# Altium schematic sheet 07_LTE_GNSS.SchDoc: LTE_GNSS
size 420 x 297 mm; SheetNumber: 8; SheetTotal: 12
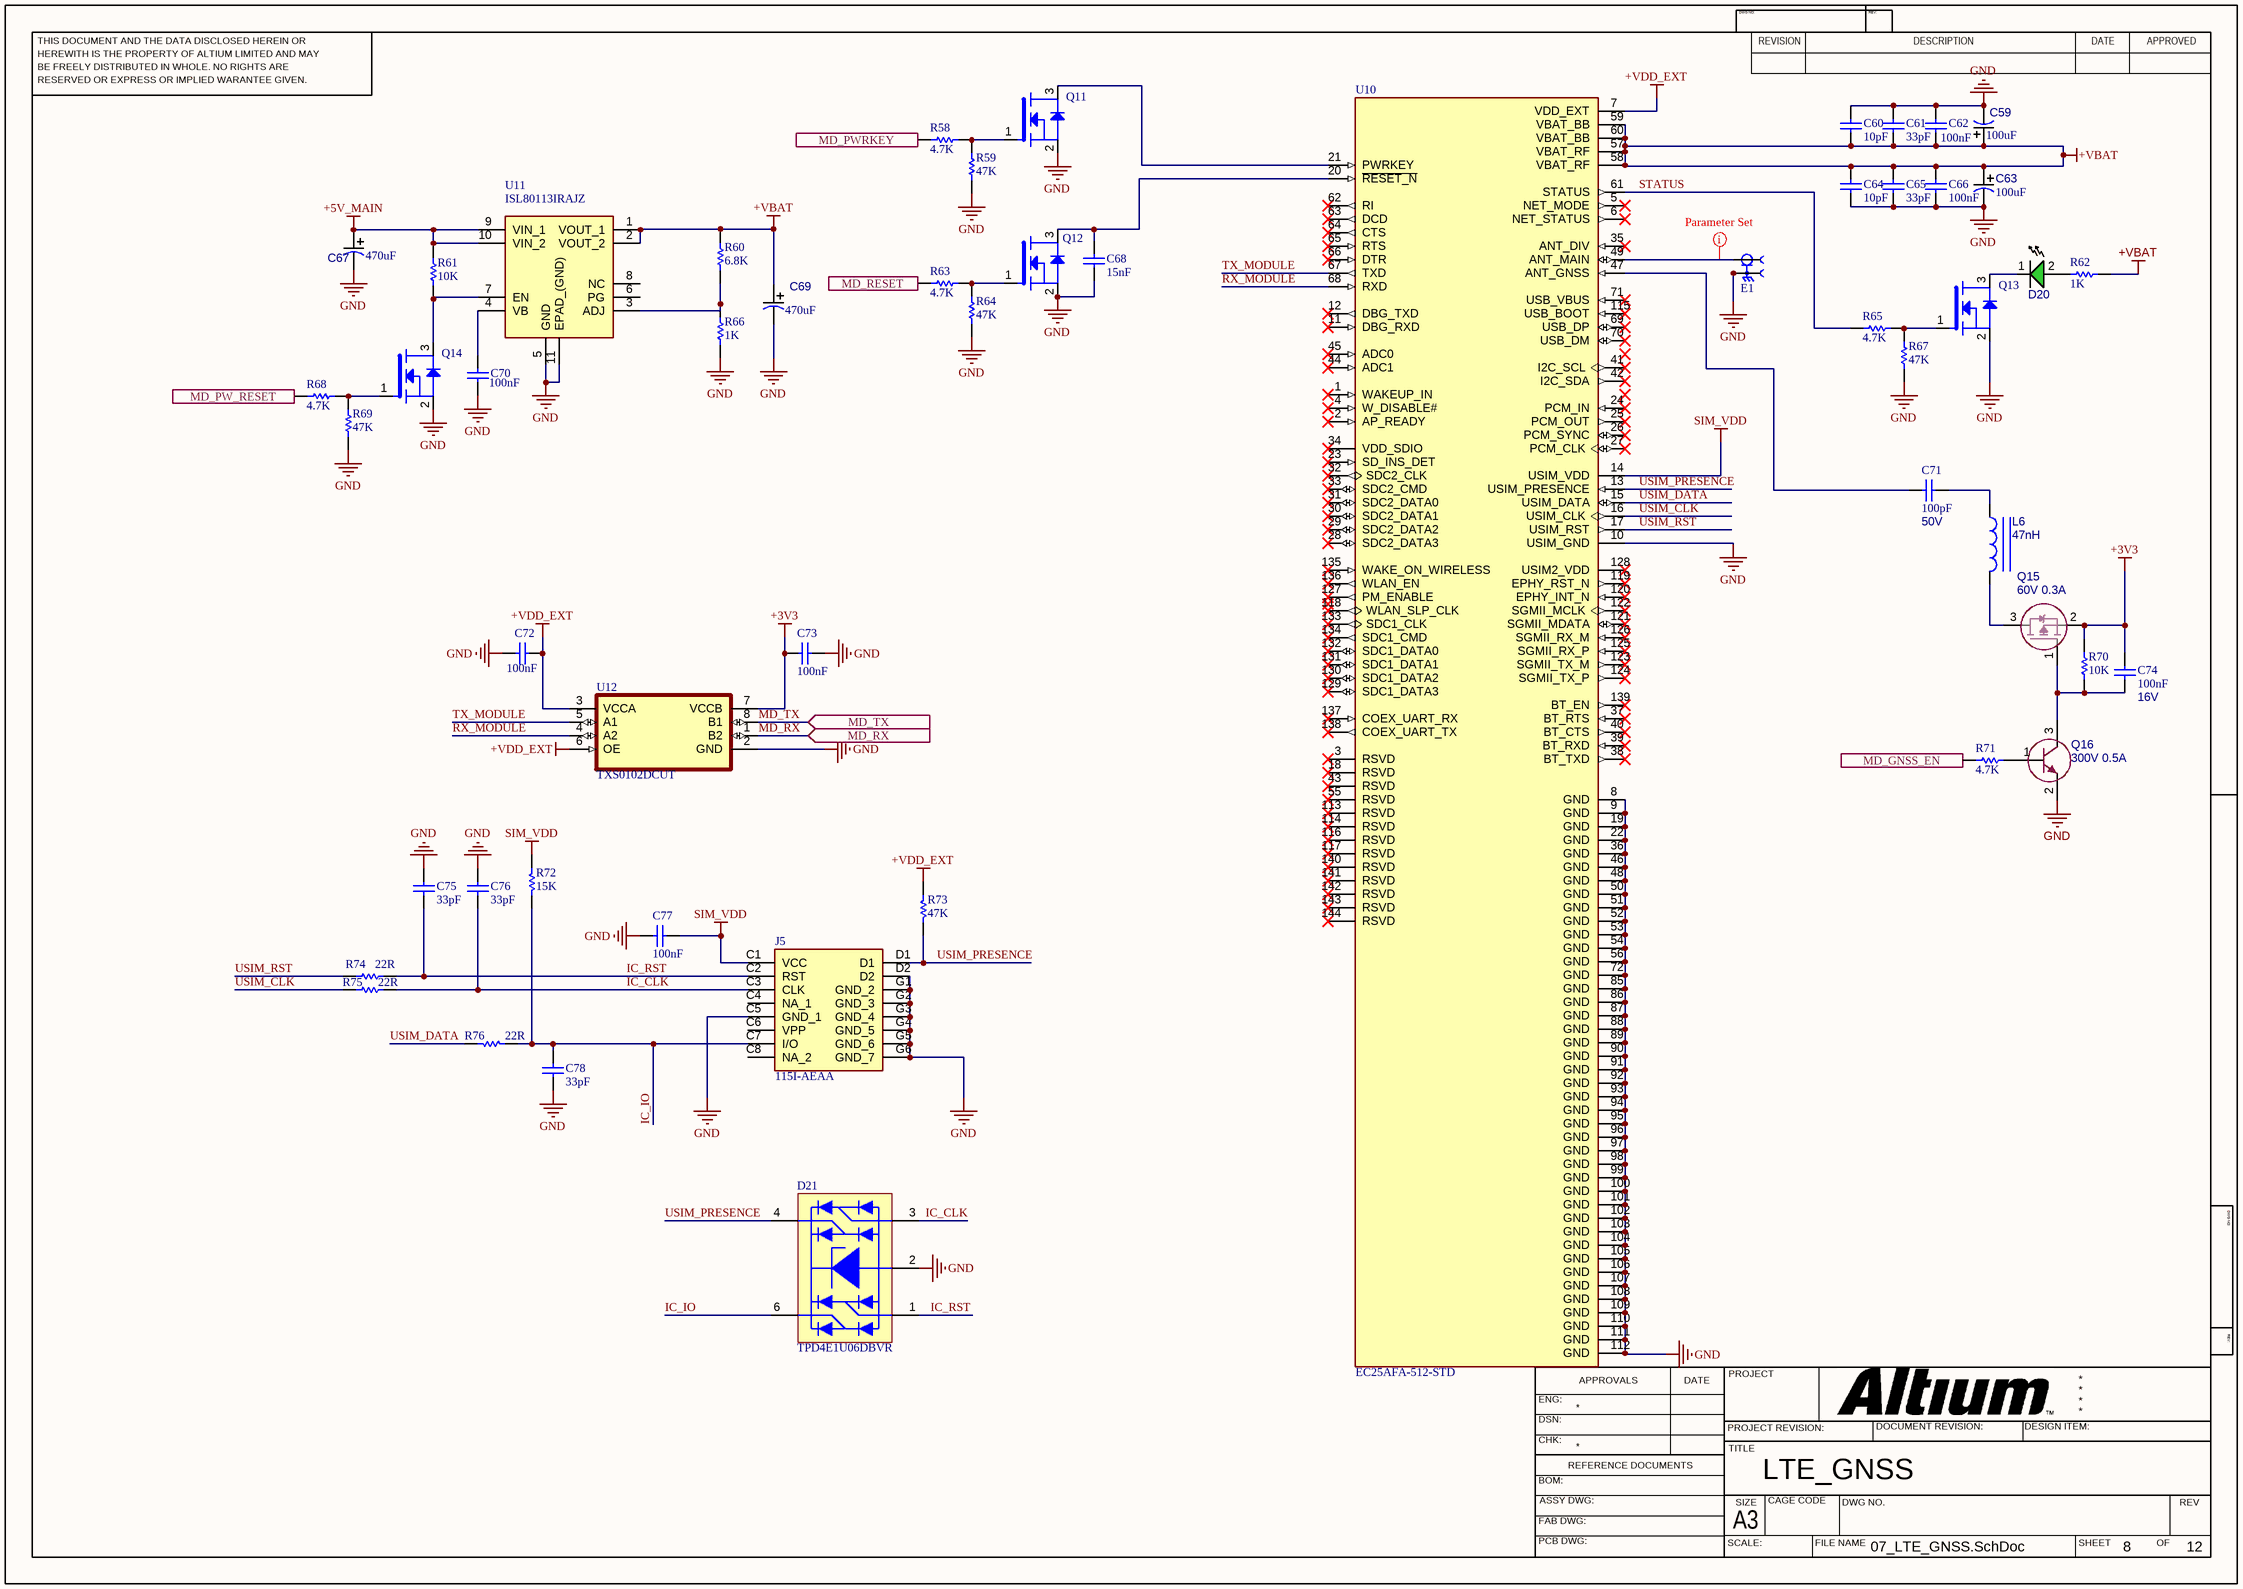
[diagram p0: 07_LTE_GNSS.SchDoc]

## Parts
C59  value 100uF  [TANTALIUM_BCASE]  (hidden comment: T491B107K006AT)
C60  value 10pF  [CAP_0603]  (hidden comment: CL10C100CB8NNNC)
C61  value 33pF  [CAP_0603]  (hidden comment: CL10C330JB8NNNC)
C62  value 100nF  [CAP_0603]  (hidden comment: CL10B104KB8NNNL)
C63  value 100uF  [TANTALIUM_BCASE]  (hidden comment: T491B107K006AT)
C64  value 10pF  [CAP_0603]  (hidden comment: CL10C100CB8NNNC)
C65  value 33pF  [CAP_0603]  (hidden comment: CL10C330JB8NNNC)
C66  value 100nF  [CAP_0603]  (hidden comment: CL10B104KB8NNNL)
C67  value 470uF  [CAP_ELEC_8X10.5 mm]  (hidden comment: MRW-016V471MF105-T/R)
C68  value 15nF  [CAP_0603]  (hidden comment: CL10B153KB85PNC)
C69  value 470uF  [CAP_ELEC_8X10.5 mm]  (hidden comment: MRW-016V471MF105-T/R)
C70  value 100nF  [CAP_0603]  (hidden comment: CL10B104KB8NNNL)
C71  value 100pF  Voltage: 50V  [CAP_0402]  (hidden comment: CC0402JRNPO9BN101)
C72  value 100nF  [CAP_0603]  (hidden comment: CL10B104KB8NNNL)
C73  value 100nF  [CAP_0603]  (hidden comment: CL10B104KB8NNNL)
C74  value 100nF  Voltage: 16V  [CAP_0402]  (hidden comment: CL05B104KO5NNNC)
C75  value 33pF  [CAP_0603]  (hidden comment: CL10C330JB8NNNC)
C76  value 33pF  [CAP_0603]  (hidden comment: CL10C330JB8NNNC)
C77  value 100nF  [CAP_0603]  (hidden comment: CL10B104KB8NNNL)
C78  value 33pF  [CAP_0603]  (hidden comment: CL10C330JB8NNNC)
D20  LTST-C190TGKT  [LED_0603_GREEN]  (value not drawn)
D21  TPD4E1U06DBVR  [SOT23_6]
E1  L-KLS1-SMA002-B  [SMA_JACK_90]  (value not drawn)
J5  115I-AEAA  [115IAEAA]
L6  value 47nH  [RES_0402]  (hidden comment: LQG15HS47NJ02D)
Q11  BSS138W-7-F  [SOT323]  (value not drawn)
Q12  BSS138W-7-F  [SOT323]  (value not drawn)
Q13  BSS138W-7-F  [SOT323]  (value not drawn)
Q14  BSS138W-7-F  [SOT323]  (value not drawn)
Q15  value 60V 0.3A  [SOT23]  (hidden comment: PJA3439_R1_00001)
Q16  value 300V 0.5A  [SOT-23-3]  (hidden comment: MMBTA42_R1_00001)
R58  value 4.7K  [RES_0603]  (hidden comment: 0603SAF4701T5E)
R59  value 47K  [RES_0603]  (hidden comment: 0603SAF4702T5E)
R60  value 6.8K  [RES_0603]  (hidden comment: 0603SAF6801T5E)
R61  value 10K  [RES_0603]  (hidden comment: 0603SAF1002T5E)
R62  value 1K  [RES_0603]  (hidden comment: RES)
R63  value 4.7K  [RES_0603]  (hidden comment: 0603SAF4701T5E)
R64  value 47K  [RES_0603]  (hidden comment: 0603SAF4702T5E)
R65  value 4.7K  [RES_0603]  (hidden comment: 0603SAF4701T5E)
R66  value 1K  [RES_0603]  (hidden comment: 0603SAF1001T5E)
R67  value 47K  [RES_0603]  (hidden comment: 0603SAF4702T5E)
R68  value 4.7K  [RES_0603]  (hidden comment: 0603SAF4701T5E)
R69  value 47K  [RES_0603]  (hidden comment: 0603SAF4702T5E)
R70  value 10K  [RES_0402]  (hidden comment: RC0402JR-0710KL)
R71  value 4.7K  [RES_0603]  (hidden comment: 0603SAF4701T5E)
R72  value 15K  [RES_0603]  (hidden comment: 0603SAJ0153T5E)
R73  value 47K  [RES_0603]  (hidden comment: 0603SAF4702T5E)
R74  value 22R  [RES_0603]  (hidden comment: 0603SAJ0220T5E)
R75  value 22R  [RES_0603]  (hidden comment: 0603SAJ0220T5E)
R76  value 22R  [RES_0603]  (hidden comment: 0603SAJ0220T5E)
U10  EC25AFA-512-STD  [XCVR_EC25AFA-512-STD]
U11  ISL80113IRAJZ  [ISL80101IRAJZ]
U12  TXS0102DCUT  [8_VSSOP]

## Ports
MD_GNSS_EN (in), MD_PW_RESET (in), MD_PWRKEY (in), MD_RESET (in), MD_RX (in), MD_TX (in)

## Nets
+3V3: C73.1 C74.1 Q15.2(S) R70.1 U12.7(VCCB)
+5V_MAIN: C67.1 R61.2 U11.9(VIN_1) U11.10(VIN_2)
+VBAT: C59.1 C60.1 C61.1 C62.1 C63.1 C64.2 C65.2 C66.2 C69.1 R60.2 R62.2 U10.57(VBAT_RF) U10.58(VBAT_RF) U10.59(VBAT_BB) U10.60(VBAT_BB) U11.1(VOUT_1) U11.2(VOUT_2)
+VDD_EXT: C72.1 R73.2 U10.7(VDD_EXT) U12.3(VCCA) U12.6(OE)
GND: C59.2 C60.2 C61.2 C62.2 C63.2 C64.1 C65.1 C66.1 C67.2 C68.1 C69.2 C70.1 C72.2 C73.2 C75.1 C76.1 C77.2 C78.1 D21.2 E1.S1 E1.S2 E1.S3 E1.S4 J5.C5(GND_1) J5.D2 J5.G1(GND_2) J5.G2(GND_3) J5.G3(GND_4) J5.G4(GND_5) J5.G5(GND_6) J5.G6(GND_7) Q11.2(S) Q12.2(S) Q13.2(S) Q14.2(S) Q16.2(E) R59.1 R64.1 R66.1 R67.1 R69.1 U10.8(GND) U10.9(GND) U10.10(USIM_GND) U10.19(GND) U10.22(GND) U10.36(GND) U10.46(GND) U10.48(GND) U10.50(GND) U10.51(GND) U10.52(GND) U10.53(GND) U10.54(GND) U10.56(GND) U10.72(GND) U10.85(GND) U10.86(GND) U10.87(GND) U10.88(GND) U10.89(GND) U10.90(GND) U10.91(GND) U10.92(GND) U10.93(GND) U10.94(GND) U10.95(GND) U10.96(GND) U10.97(GND) U10.98(GND) U10.99(GND) U10.100(GND) U10.101(GND) U10.102(GND) U10.103(GND) U10.104(GND) U10.105(GND) U10.106(GND) U10.107(GND) U10.108(GND) U10.109(GND) U10.110(GND) U10.111(GND) U10.112(GND) U11.5(GND) U11.11(EPAD_(GND)) U12.2(GND)
SIM_VDD: C77.1 J5.C1(VCC) R72.2 U10.14(USIM_VDD)
IC_CLK: C76.2 D21.3 J5.C3(CLK) R75.2
IC_IO: C78.2 D21.6 J5.C7(I/O) R72.1 R76.1
IC_RST: C75.2 D21.1 J5.C2(RST) R74.2
MD_GNSS_EN: R71.1 ; port MD_GNSS_EN
MD_PW_RESET: R68.1 ; port MD_PW_RESET
MD_PWRKEY: R58.1 ; port MD_PWRKEY
MD_RESET: R63.1 ; port MD_RESET
MD_RX: U12.1(B2) ; port MD_RX
MD_TX: U12.8(B1) ; port MD_TX
RX_MODULE: U10.68(RXD) U12.4(A2)
STATUS: R65.1 U10.61(STATUS)
TX_MODULE: U10.67(TXD) U12.5(A1)
USIM_CLK: R75.1 U10.16(USIM_CLK)
USIM_DATA: R76.2 U10.15(USIM_DATA)
USIM_PRESENCE: D21.4 J5.D1 R73.1 U10.13(USIM_PRESENCE)
USIM_RST: R74.1 U10.17(USIM_RST)
NetC68_2: C68.2 Q12.3(D) U10.20(~{RESET_N})
NetC70_2: C70.2 U11.4(VB)
NetC71_1: C71.1 L6.1
NetC71_2: C71.2 U10.47(ANT_GNSS)
NetC74_2: C74.2 Q15.1(G) Q16.3(C) R70.2
NetD20_1: D20.1 Q13.3(D)
NetD20_2: D20.2 R62.1
NetE1_1: E1.1 U10.49(ANT_MAIN)
NetL6_2: L6.2 Q15.3(D)
NetQ11_1: Q11.1(G) R58.2 R59.2
NetQ11_3: Q11.3(D) U10.21(PWRKEY)
NetQ12_1: Q12.1(G) R63.2 R64.2
NetQ13_1: Q13.1(G) R65.2 R67.2
NetQ14_1: Q14.1(G) R68.2 R69.2
NetQ14_3: Q14.3(D) R61.1 U11.7(EN)
NetQ16_1: Q16.1(B) R71.2
NetR60_1: R60.1 R66.2 U11.3(ADJ)

Not connected (* = marked no-connect by the designer): J5 C4(NA_1) C6(VPP) C8(NA_2); U10 1(WAKEUP_IN)* 2(AP_READY)* 3(RSVD)* 4(W_DISABLE#)* 5(NET_MODE)* 6(NET_STATUS)* 11(DBG_RXD)* 12(DBG_TXD)* 18(RSVD)* 23(SD_INS_DET)* 24(PCM_IN)* 25(PCM_OUT)* 26(PCM_SYNC)* 27(PCM_CLK)* 28(SDC2_DATA3)* 29(SDC2_DATA2)* 30(SDC2_DATA1)* 31(SDC2_DATA0)* 32(SDC2_CLK)* 33(SDC2_CMD)* 34(VDD_SDIO)* 35(ANT_DIV)* 37(BT_RTS)* 38(BT_TXD)* 39(BT_RXD)* 40(BT_CTS)* 41(I2C_SCL)* 42(I2C_SDA)* 43(RSVD)* 44(ADC1)* 45(ADC0)* 55(RSVD)* 62(RI)* 63(DCD)* 64(CTS)* 65(RTS)* 66(DTR)* 69(USB_DP)* 70(USB_DM)* 71(USB_VBUS)* 113(RSVD)* 114(RSVD)* 115(USB_BOOT)* 116(RSVD)* 117(RSVD)* 118(WLAN_SLP_CLK)* 119(EPHY_RST_N)* 120(EPHY_INT_N)* 121(SGMII_MDATA)* 122(SGMII_MCLK)* 123(SGMII_TX_M)* 124(SGMII_TX_P)* 125(SGMII_RX_P)* 126(SGMII_RX_M)* 127(PM_ENABLE)* 128(USIM2_VDD)* 129(SDC1_DATA3)* 130(SDC1_DATA2)* 131(SDC1_DATA1)* 132(SDC1_DATA0)* 133(SDC1_CLK)* 134(SDC1_CMD)* 135(WAKE_ON_WIRELESS)* 136(WLAN_EN)* 137(COEX_UART_RX)* 138(COEX_UART_TX)* 139(BT_EN)* 140(RSVD)* 141(RSVD)* 142(RSVD)* 143(RSVD)* 144(RSVD)*; U11 6(PG) 8(NC)

## Layout directives
rule Width Constraint [Pref Width = 0.389mm    Min Width = 0.254mm    Max Width = 0.389mm]: NetE1_1

## Notes on the sheet
- THIS DOCUMENT AND THE DATA DISCLOSED HEREIN OR
- HEREWITH IS THE PROPERTY OF ALTIUM LIMITED AND MAY
- DWG NO:
- REVISION
- REV:
- DESCRIPTION
- DATE
- APPROVED
- BE FREELY DISTRIBUTED IN WHOLE. NO RIGHTS ARE
- RESERVED OR EXPRESS OR IMPLIED WARANTEE GIVEN.
- ENG:
- APPROVALS
- PROJECT
- DSN:
- CHK:
- REFERENCE DOCUMENTS
- PROJECT REVISION:
- TITLE
- DOCUMENT REVISION:
- DESIGN ITEM:
- BOM:
- FAB DWG:
- PCB DWG:
- ASSY DWG:
- SCALE:
- A3
- SIZE
- CAGE CODE
- FILE NAME
- DWG NO.
- SHEET
- OF
- REV

## Library data of the parts
C59 C63 = T491B107K006AT: CAP.TANTAL 100uF 6.3V 10% B CASE (3528) SMD KEMET; Manufacturer: KEMET; Manufacturer Part Number: T491B107K006AT; Supplier 1: Ozdisan
C60 C64 = CL10C100CB8NNNC: MLCC (1608) 0603 10pF 50VDC ±0.25pF C0G (NP0); Manufacturer: SAMSUNG; Supplier 1: Ozdisan; Manufacturer Part Number: CL10C100CB8NNNC
C61 C65 C75 C76 C78 = CL10C330JB8NNNC: MLCC (1608) 0603 33pF 50VDC ±5% C0G (NP0); Manufacturer: Samsung Electro-Mechanics America, Inc; Supplier 1: OZDISAN; Manufacturer Part Number: CL10C330JB8NNNC
C62 C66 C70 C72 C73 C77 = CL10B104KB8NNNL: MLCC (1608) 0603 100nF 50VDC ±10% X7R; Manufacturer: Samsung Electro-Mechanics America, Inc; Supplier 1: OZDISAN; Manufacturer Part Number: CL10B104KB8NNNL
C67 C69 = MRW-016V471MF105-T/R: CAP.EL.470uF 16V 8x10.5 105C 2000Hrs SMD; Manufacturer: KOSHIN; Manufacturer Part Number: MRW-016V471MF105-T/R; Supplier 1: Ozdisan
C68 = CL10B153KB85PNC: MLCC (1608) 0603 15nF 50VDC ±10% X7R AUTOMOTIVE; Manufacturer: SAMSUNG; Supplier 1: OZDISAN; Manufacturer Part Number: CL10B153KB85PNC
C71 = CL10B103KB8NNNL: MLCC (1005) 0402 100pF 50VDC ±5% C0G (NP0); Manufacturer: YAGEO; Manufacturer Part Number: CC0402JRNPO9BN101
C74 = CL10B103KB8NNNL: MLCC (1005) 0402 100nF 16VDC ±10% X7R; Manufacturer: SAMSUNG; Manufacturer Part Number: CL05B104KO5NNNC
D20 = LTST-C190TGKT: LED SMD 0603 GREEN 71-450mcd 130° WATER CLEAR; Manufacturer: LITEON; Package: 0603(1608 Metric); Manufacturer Part Number: LTST-C190TGKT; Value: GREEN
D21 = TPD4E1U06DBVR: DIODE TVS 45W 15V SOT23-6; Manufacturer: TEXAS; Value: *; Supplier 1: OZDISAN; Manufacturer Part Number: TPD4E1U06DBVR
E1 = L-KLS1-SMA002-B: CONNECTOR ANTENNA SMA JACK R/A 50M; Manufacturer: KLS ELECTRONIC; Manufacturer Part Number: L-KLS1-SMA002-B; Supplier 1: OZDISAN
J5 = 115I-AEAA: Connector; Manufacturer_Name: ATTEND; Datasheet Link: https://www.attend.com.tw/data/download/file/115I-AEAA.pdf; Height: 1.52mm; Manufacturer_Part_Number: 115I-AEAA
L6 = CBC3225T100MR: INDUCTOR FIXED 0402 47nH 300mA SMD; Manufacturer: MURATA; Package: 0402 (1005 Metric); Manufacturer Part Number: LQG15HS47NJ02D
Q11-Q14 = BSS138W-7-F: MOSFET DIS.200mA 50V N-CH SC70-3; Manufacturer: DIODES; Value: *; Supplier 1: OZDISAN; Manufacturer Part Number: BSS138W-7-F
Q15 = PJA3439_R1_00001: MOSFET P-CH 60V 300mA SOT23 SMT; Manufacturer: Panjit International Inc.; Package: SOT23; Manufacturer Part Number: PJA3439_R1_00001; Supplier Part Number 1: 3757-PJA3439_R1_00001TR-ND; Supplier Part Number 2: 241-PJA3439_R1_00001; Supplier Part Number 3: PJA3439_R1_00001; Supplier 1: DIGIKEY; Supplier 2: MOUSER; Supplier 3: OZDISAN
Q16 = MMBTA42_R1_00001: TRANSISTOR DIS.500mA 300V NPN SOT23 GEN. SMT; Manufacturer: PANJIT; Package: SOT23; Supplier Part Number 1: 3757-MMBTA42_R1_00001CT-ND; Supplier Part Number 2: *; Supplier Part Number 3: MMBTA42_R1_00001; Supplier 1: DIGIKEY; Supplier 2: MOUSER; Supplier 3: OZDISAN; Manufacturer Part Number: MMBTA42_R1_00001
R58 R63 R65 R68 R71 = 0603SAF4701T5E: RES.(1608) 0603 4.7K Ohms 1% 1/10W-S 100PPM; Manufacturer: ROYALOHM; Supplier 1: Ozdisan; Manufacturer Part Number: 0603SAF4701T5E
R59 R64 R67 R69 R73 = 0603SAF4702T5E: RES.(1608) 0603 47K Ohms 1% 1/10W-S 100PPM; Manufacturer: ROYALOHM; Supplier 1: Ozdisan; Manufacturer Part Number: 0603SAF4702T5E
R60 = 0603SAF6801T5E: RES.(1608) 0603 6.8K Ohms 1% 1/10W-S 100PPM; Manufacturer: ROYALOHM; Supplier 1: Ozdisan; Manufacturer Part Number: 0603SAF6801T5E
R61 = 0603SAF1002T5E: RES.(1608) 0603 10K Ohms 1% 1/10W-S 100PPM; Manufacturer: ROYALOHM; Supplier 1: Ozdisan; Manufacturer Part Number: 0603SAF1002T5E
R62 = R02998: RES 0603 1K Ohms 1% 1/10W-S 100PPM; Manufacturer: ROYALOHM; Manufacturer Part Number: 0603SAF1001T5E
R66 = 0603SAF1001T5E: RES.(1608) 0603 1K Ohms 1% 1/10W-S 100PPM; Manufacturer: ROYALOHM; Supplier 1: Ozdisan; Manufacturer Part Number: 0603SAF1001T5E
R70 = R03000: RES.(1005) 0402 10K Ohms 5% 1/16W 100PPM SMT; Manufacturer: YAGEO; Manufacturer Part Number: RC0402JR-0710KL
R72 = 0603SAJ0153T5E: RES.(1608) 0603 15K Ohms 5% 1/10W-S 100PPM; Manufacturer: ROYALOHM; Supplier 1: Ozdisan; Manufacturer Part Number: 0603SAJ0153T5E
R74-R76 = 0603SAJ0220T5E: RES.(1608) 0603 22 Ohms 5% 1/10W-S 200PPM; Manufacturer: ROYALOHM; Supplier 1: Ozdisan; Manufacturer Part Number: 0603SAJ0220T5E
U10 = EC25AFA-512-STD: Quectel EC25 is a series of 4G - LTE Cat 4 module optimized specially for M2M and IoT applications.; Availability: In Stock; Package: Custom Quectel; MP: EC25AFA-512-STD; SnapEDA_Link: https://www.snapeda.com/parts/EC25AFA-512-STD/Quectel/view-part/?ref=snap; MF: Quectel; Purchase-URL: https://pricing.snapeda.com/search/part/EC25AFA-512-STD/?ref=eda; Value: *; Check_prices: https://www.snapeda.com/parts/EC25AFA-512-STD/Quectel/view-part/?ref=eda; Price: None
U11 = ISL80113IRAJZ: Linear Voltage Regulator IC Positive Adjustable 1 Output 3A 10-DFN (3x3); Manufacturer: Renesas Electronics Corporation; Value: IC REG LINEAR POS ADJ 3A 10DFN; Supplier 1: DIGIKEY; Manufacturer Part Number: ISL80113IRAJZ
U12 = TXS0102DCUT: Voltage Level Translator Bidirectional 1 Circuit 2 Channel 24Mbps 8-VSSOP; Manufacturer: Texas Instruments; Value: *; Supplier 1: DIGIKEY; Manufacturer Part Number: TXS0102DCUT